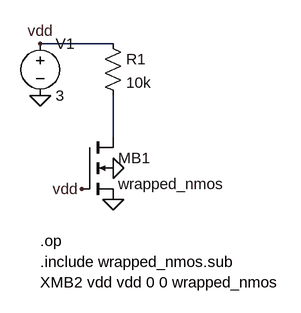
[diagram p0: schematic sheet_part_names.asc]
sheet_part_names.asc, the LTspice schematic file:
Version 4
SHEET 1 880 680
WIRE 0 16 112 16
WIRE 112 96 112 160
FLAG 0 16 vdd
FLAG 0 96 0
FLAG 64 240 vdd
FLAG 112 208 0
FLAG 112 256 0
SYMBOL voltage 0 0 R0
SYMATTR InstName V1
SYMATTR Value 3
SYMBOL res 96 0 R0
SYMATTR InstName R1
SYMATTR Value 10k
SYMBOL nmos4 64 160 R0
SYMATTR InstName MB1
SYMATTR Prefix X
SYMATTR Value wrapped_nmos
TEXT 0 320 Left 2 !.op
TEXT 0 352 Left 2 !.include wrapped_nmos.sub
TEXT 0 384 Left 2 !XMB2 vdd vdd 0 0 wrapped_nmos

The netlist it stands for:
* sheet_part_names.asc
V1 vdd 0 3
R1 vdd N001 10k
XMB1 N001 vdd 0 0 wrapped_nmos  ; pins D G S B
.op
.include wrapped_nmos.sub
XMB2 vdd vdd 0 0 wrapped_nmos
.backanno
.end